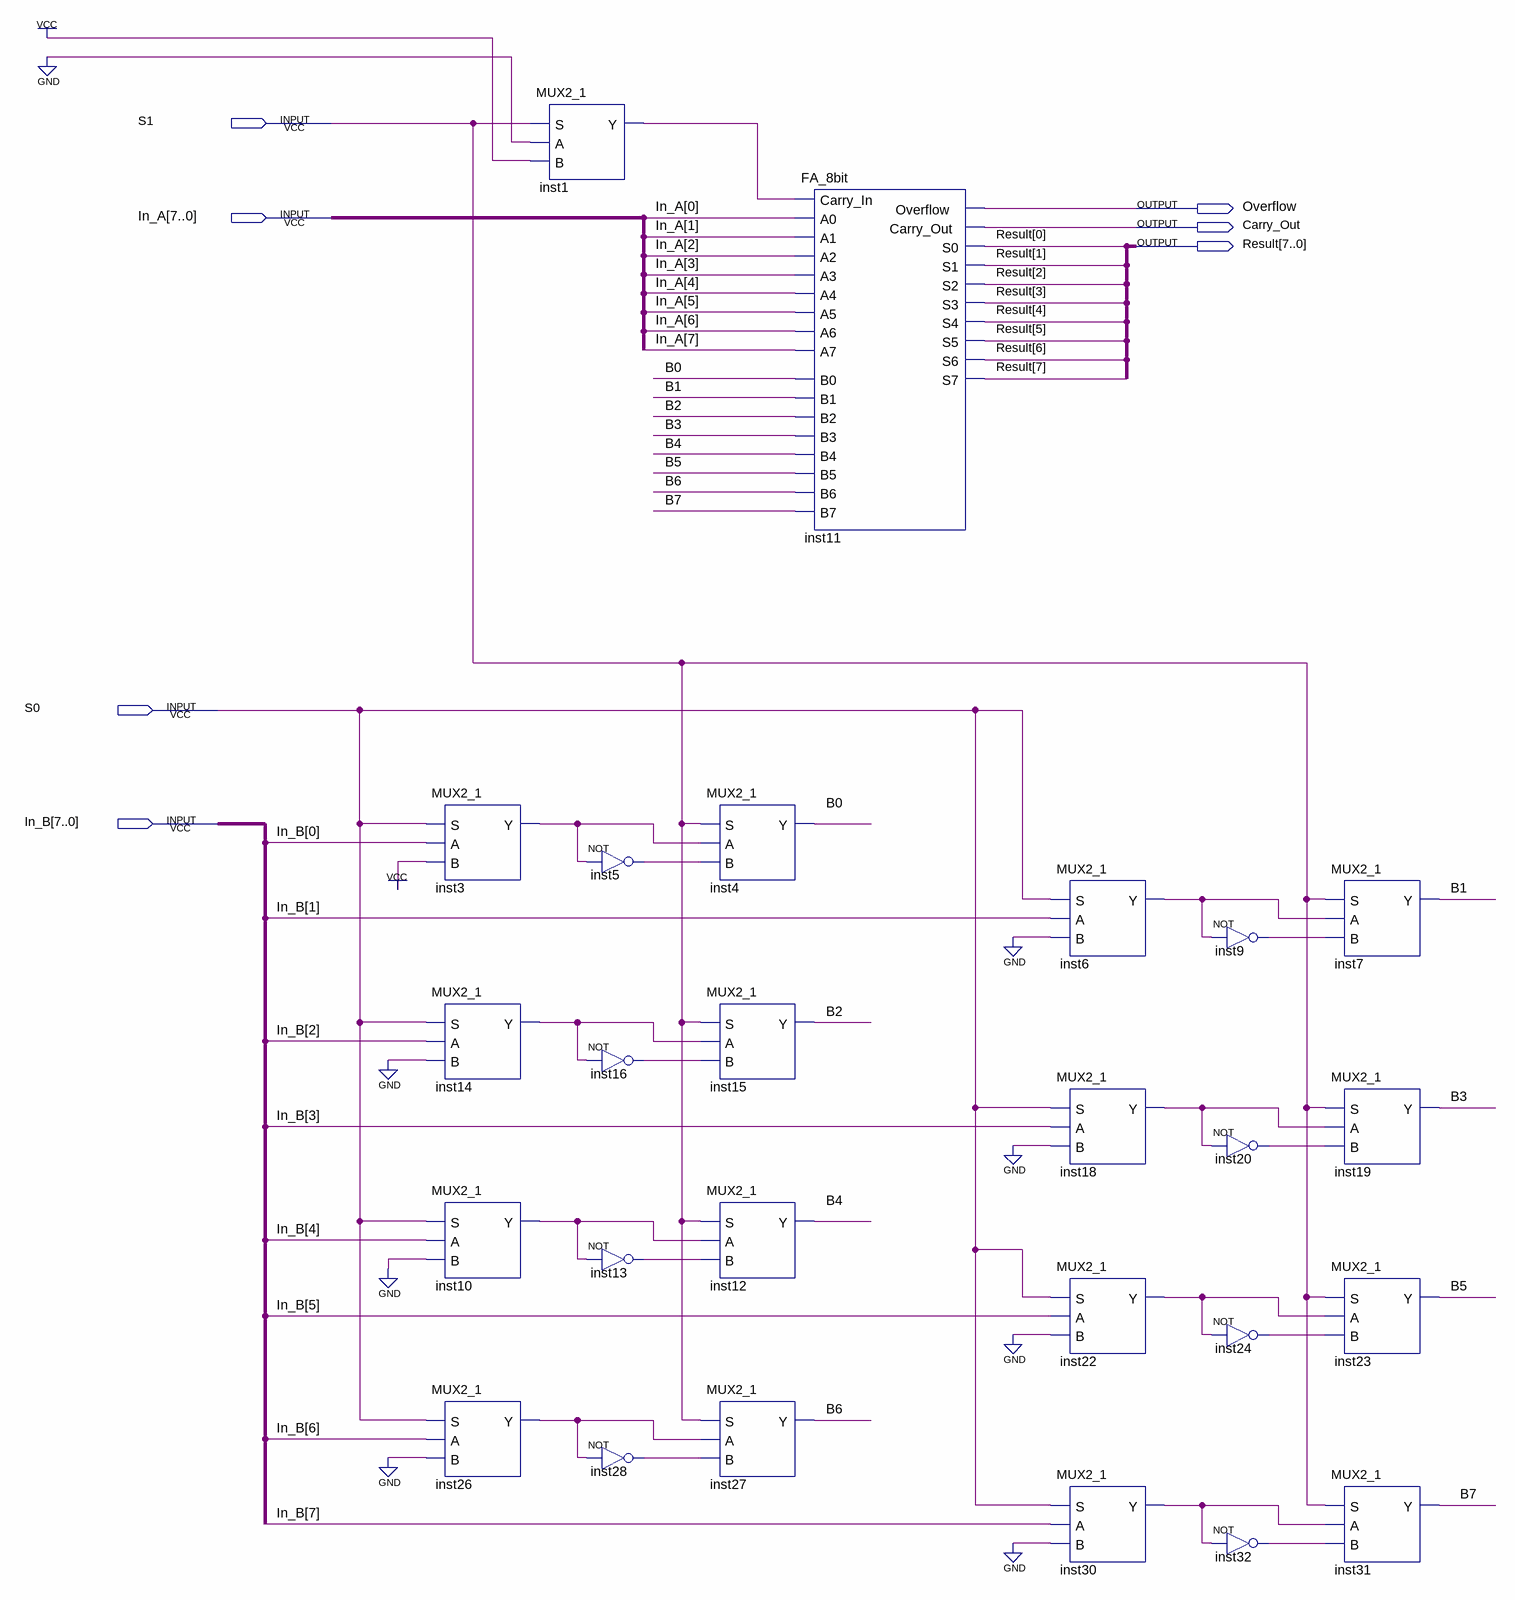
[diagram p0: schematic sheet]
// Quartus schematic AU_8bit.bdf as structural Verilog: 26 symbols, 7 pins
module AU_8bit (
  input  S1,
  input  [7:0] In_A,
  input  S0,
  input  [7:0] In_B,
  output Overflow,
  output Carry_Out,
  output [7:0] Result
);

  wire B0, B1, B2, B3, B4, B5, B6, B7, inst1_y, inst3_y, inst5_out, inst6_y, inst9_out, inst10_y, inst13_out,
       inst14_y, inst16_out, inst18_y, inst20_out, inst22_y, inst24_out, inst26_y, inst28_out, inst30_y,
       inst32_out;

  MUX2_1 inst3 (.S(S0), .A(In_B[0]), .B(1'b1), .Y(inst3_y));
  MUX2_1 inst14 (.S(S0), .A(In_B[2]), .B(1'b0), .Y(inst14_y));
  MUX2_1 inst10 (.S(S0), .A(In_B[4]), .B(1'b0), .Y(inst10_y));
  MUX2_1 inst26 (.S(S0), .A(In_B[6]), .B(1'b0), .Y(inst26_y));
  MUX2_1 inst1 (.S(S1), .A(1'b0), .B(1'b1), .Y(inst1_y));
  not inst5 (inst5_out, inst3_y);
  not inst16 (inst16_out, inst14_y);
  not inst13 (inst13_out, inst10_y);
  not inst28 (inst28_out, inst26_y);
  MUX2_1 inst4 (.S(S1), .A(inst3_y), .B(inst5_out), .Y(B0));
  MUX2_1 inst15 (.S(S1), .A(inst14_y), .B(inst16_out), .Y(B2));
  MUX2_1 inst12 (.S(S1), .A(inst10_y), .B(inst13_out), .Y(B4));
  MUX2_1 inst27 (.S(S1), .A(inst26_y), .B(inst28_out), .Y(B6));
  FA_8bit inst11 (
    .A0(In_A[0]), .B0(B0), .B1(B1), .A1(In_A[1]), .B2(B2), .A2(In_A[2]), .B3(B3), .A3(In_A[3]), .A4(In_A[4]),
    .B4(B4), .B5(B5), .A5(In_A[5]), .B6(B6), .A6(In_A[6]), .B7(B7), .A7(In_A[7]), .Carry_In(inst1_y),
    .Overflow(Overflow), .Carry_Out(Carry_Out), .S0(Result[0]), .S1(Result[1]), .S2(Result[2]),
    .S3(Result[3]), .S4(Result[4]), .S5(Result[5]), .S6(Result[6]), .S7(Result[7]));
  MUX2_1 inst6 (.S(S0), .A(In_B[1]), .B(1'b0), .Y(inst6_y));
  MUX2_1 inst18 (.S(S0), .A(In_B[3]), .B(1'b0), .Y(inst18_y));
  MUX2_1 inst22 (.S(S0), .A(In_B[5]), .B(1'b0), .Y(inst22_y));
  MUX2_1 inst30 (.S(S0), .A(In_B[7]), .B(1'b0), .Y(inst30_y));
  not inst9 (inst9_out, inst6_y);
  not inst20 (inst20_out, inst18_y);
  not inst24 (inst24_out, inst22_y);
  not inst32 (inst32_out, inst30_y);
  MUX2_1 inst7 (.S(S1), .A(inst6_y), .B(inst9_out), .Y(B1));
  MUX2_1 inst19 (.S(S1), .A(inst18_y), .B(inst20_out), .Y(B3));
  MUX2_1 inst23 (.S(S1), .A(inst22_y), .B(inst24_out), .Y(B5));
  MUX2_1 inst31 (.S(S1), .A(inst30_y), .B(inst32_out), .Y(B7));
endmodule
